# Altium schematic sheet Dahili Moduller 1.SchDoc
size A4; SheetNumber: 4; SheetTotal: 7
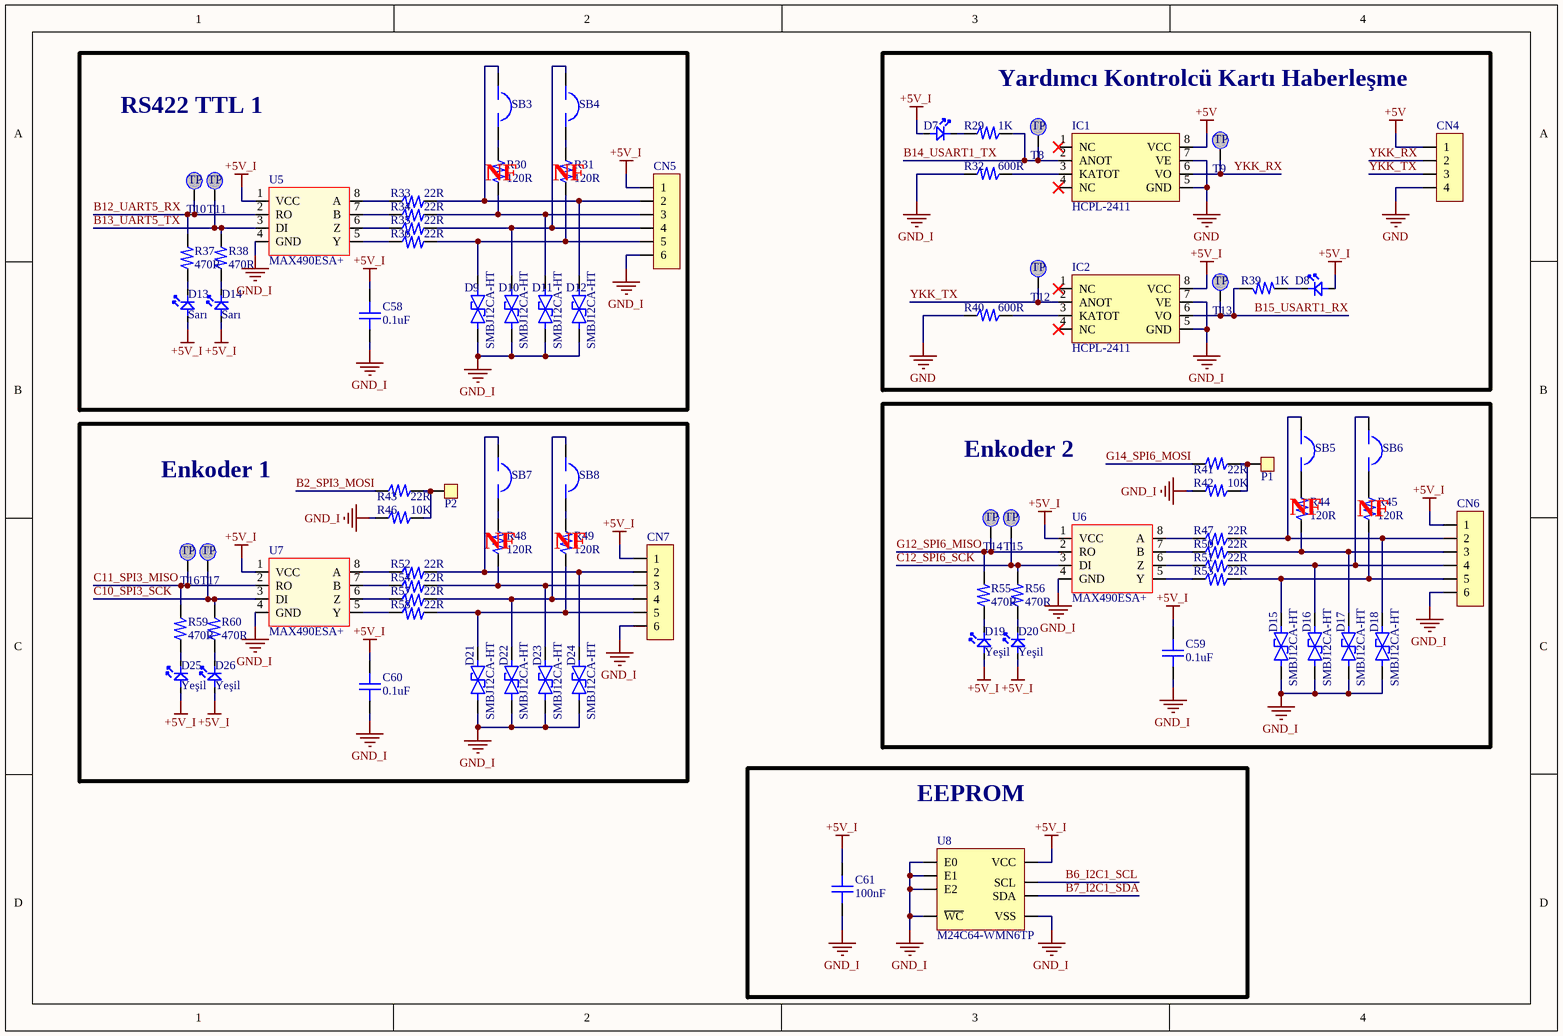
[diagram p0: Dahili Moduller 1.SchDoc]

## Parts
C58  0.1uF  [0805 Kapasıtor]
C59  0.1uF  [0805 Kapasıtor]
C60  0.1uF  [0805 Kapasıtor]
C61  100nF  [0805 Kapasıtor]
CN4  4_Pin_JST_Male  [4_Pin_JST_Male]  (value not drawn)
CN5  6_Pin_JST_Male  [6_Pin_JST_Male]  (value not drawn)
CN6  6_Pin_JST_Male  [6_Pin_JST_Male]  (value not drawn)
CN7  6_Pin_JST_Male  [6_Pin_JST_Male]  (value not drawn)
D7  0805 LED  [0805 LED]  (value not drawn)
D8  0805 LED  [0805 LED]  (value not drawn)
D9  SMBJ12CA-HT  [SMB/DO-214AA]
D10  SMBJ12CA-HT  [SMB/DO-214AA]
D11  SMBJ12CA-HT  [SMB/DO-214AA]
D12  SMBJ12CA-HT  [SMB/DO-214AA]
D13  Sarı  [0805 LED]
D14  Sarı  [0805 LED]
D15  SMBJ12CA-HT  [SMB/DO-214AA]
D16  SMBJ12CA-HT  [SMB/DO-214AA]
D17  SMBJ12CA-HT  [SMB/DO-214AA]
D18  SMBJ12CA-HT  [SMB/DO-214AA]
D19  Yeşil  [0805 LED]
D20  Yeşil  [0805 LED]
D21  SMBJ12CA-HT  [SMB/DO-214AA]
D22  SMBJ12CA-HT  [SMB/DO-214AA]
D23  SMBJ12CA-HT  [SMB/DO-214AA]
D24  SMBJ12CA-HT  [SMB/DO-214AA]
D25  Yeşil  [0805 LED]
D26  Yeşil  [0805 LED]
IC1  HCPL-2411  [DIP8-2.54]
IC2  HCPL-2411  [DIP8-2.54]
P1  ped  [ped]  (value not drawn)
P2  ped  [ped]  (value not drawn)
R29  1K  [0805 Dırenc]
R30  120R  [0805 Dırenc]
R31  120R  [0805 Dırenc]
R32  600R  [0805 Dırenc]
R33  22R  [0805 Dırenc]
R34  22R  [0805 Dırenc]
R35  22R  [0805 Dırenc]
R36  22R  [0805 Dırenc]
R37  470R  [0805 Dırenc]
R38  470R  [0805 Dırenc]
R39  1K  [0805 Dırenc]
R40  600R  [0805 Dırenc]
R41  22R  [0805 Dırenc]
R42  10K  [0805 Dırenc]
R43  22R  [0805 Dırenc]
R44  120R  [0805 Dırenc]
R45  120R  [0805 Dırenc]
R46  10K  [0805 Dırenc]
R47  22R  [0805 Dırenc]
R48  120R  [0805 Dırenc]
R49  120R  [0805 Dırenc]
R50  22R  [0805 Dırenc]
R51  22R  [0805 Dırenc]
R52  22R  [0805 Dırenc]
R53  22R  [0805 Dırenc]
R54  22R  [0805 Dırenc]
R55  470R  [0805 Dırenc]
R56  470R  [0805 Dırenc]
R57  22R  [0805 Dırenc]
R58  22R  [0805 Dırenc]
R59  470R  [0805 Dırenc]
R60  470R  [0805 Dırenc]
SB3  Solder_Bridge  [Solder_Bridge]  (value not drawn)
SB4  Solder_Bridge  [Solder_Bridge]  (value not drawn)
SB5  Solder_Bridge  [Solder_Bridge]  (value not drawn)
SB6  Solder_Bridge  [Solder_Bridge]  (value not drawn)
SB7  Solder_Bridge  [Solder_Bridge]  (value not drawn)
SB8  Solder_Bridge  [Solder_Bridge]  (value not drawn)
T8  Test Noktası  [Test Noktası]  (value not drawn)
T9  Test Noktası  [Test Noktası]  (value not drawn)
T10  Test Noktası  [Test Noktası]  (value not drawn)
T11  Test Noktası  [Test Noktası]  (value not drawn)
T12  Test Noktası  [Test Noktası]  (value not drawn)
T13  Test Noktası  [Test Noktası]  (value not drawn)
T14  Test Noktası  [Test Noktası]  (value not drawn)
T15  Test Noktası  [Test Noktası]  (value not drawn)
T16  Test Noktası  [Test Noktası]  (value not drawn)
T17  Test Noktası  [Test Noktası]  (value not drawn)
U5  MAX490ESA+  [8-SOIC]
U6  MAX490ESA+  [8-SOIC]
U7  MAX490ESA+  [8-SOIC]
U8  M24C64-WMN6TP  [SOIC127P600X175-8N]

## Blocks framed on the sheet
Yardımcı Kontrolcü Kartı Haberleşme: CN4 D7 D8 IC1 IC2 R29 R32 R39 R40 T8 T9 T12 T13
EEPROM: C61 U8

## Nets
+5V: CN4.1 IC1.8(VCC)
+5V_I: C58.2 C59.2 C60.2 C61.2 CN5.1 CN6.1 CN7.1 D7.1 D8.1 D13.1 D14.1 D19.1 D20.1 D25.1 D26.1 IC2.8(VCC) U5.1(VCC) U6.1(VCC) U7.1(VCC) U8.8(VCC)
GND: CN4.4 IC1.5(GND) IC1.7(VE) R40.1
GND_I: C58.1 C59.1 C60.1 C61.1 CN5.6 CN6.6 CN7.6 D9.1 D10.1 D11.1 D12.1 D15.1 D16.1 D17.1 D18.1 D21.1 D22.1 D23.1 D24.1 IC2.5(GND) IC2.7(VE) R32.1 R42.1 R46.1 U5.4(GND) U6.4(GND) U7.4(GND) U8.1(E0) U8.2(E1) U8.3(E2) U8.4(VSS) U8.7(~{WC})
B2_SPI3_MOSI: R43.1
B6_I2C1_SCL: U8.6(SCL)
B7_I2C1_SDA: U8.5(SDA)
B12_UART5_RX: R37.2 T10.1 U5.2(RO)
B13_UART5_TX: R38.2 T11.1 U5.3(DI)
B14_USART1_TX: IC1.2(ANOT) R29.2 T8.1
B15_USART1_RX: IC2.6(VO) R39.2 T13.1
C10_SPI3_SCK: R60.2 T17.1 U7.3(DI)
C11_SPI3_MISO: R59.2 T16.1 U7.2(RO)
C12_SPI6_SCK: R56.2 T15.1 U6.3(DI)
G12_SPI6_MISO: R55.2 T14.1 U6.2(RO)
G14_SPI6_MOSI: R41.1
YKK_RX: CN4.2 IC1.6(VO) T9.1
YKK_TX: CN4.3 IC2.2(ANOT) T12.1
NetCN5_2: CN5.2 D12.2 R33.1 SB3.1
NetCN5_3: CN5.3 D11.2 R30.2 R34.1
NetCN5_4: CN5.4 D10.2 R35.1 SB4.1
NetCN5_5: CN5.5 D9.2 R31.2 R36.1
NetCN6_2: CN6.2 D18.2 R47.1 SB5.1
NetCN6_3: CN6.3 D17.2 R44.2 R50.1
NetCN6_4: CN6.4 D16.2 R51.1 SB6.1
NetCN6_5: CN6.5 D15.2 R45.2 R53.1
NetCN7_2: CN7.2 D24.2 R52.1 SB7.1
NetCN7_3: CN7.3 D23.2 R48.2 R54.1
NetCN7_4: CN7.4 D22.2 R57.1 SB8.1
NetCN7_5: CN7.5 D21.2 R49.2 R58.1
NetD7_2: D7.2 R29.1
NetD8_2: D8.2 R39.1
NetD13_2: D13.2 R37.1
NetD14_2: D14.2 R38.1
NetD19_2: D19.2 R55.1
NetD20_2: D20.2 R56.1
NetD25_2: D25.2 R59.1
NetD26_2: D26.2 R60.1
NetIC1_3: IC1.3(KATOT) R32.2
NetIC2_3: IC2.3(KATOT) R40.2
NetP1_1: P1.1 R41.2 R42.2
NetP2_1: P2.1 R43.2 R46.2
NetR30_1: R30.1 SB3.2
NetR31_1: R31.1 SB4.2
NetR33_2: R33.2 U5.8(A)
NetR34_2: R34.2 U5.7(B)
NetR35_2: R35.2 U5.6(Z)
NetR36_2: R36.2 U5.5(Y)
NetR44_1: R44.1 SB5.2
NetR45_1: R45.1 SB6.2
NetR47_2: R47.2 U6.8(A)
NetR48_1: R48.1 SB7.2
NetR49_1: R49.1 SB8.2
NetR50_2: R50.2 U6.7(B)
NetR51_2: R51.2 U6.6(Z)
NetR52_2: R52.2 U7.8(A)
NetR53_2: R53.2 U6.5(Y)
NetR54_2: R54.2 U7.7(B)
NetR57_2: R57.2 U7.6(Z)
NetR58_2: R58.2 U7.5(Y)

Not connected (* = marked no-connect by the designer): IC1 1(NC)* 4(NC)*; IC2 1(NC)* 4(NC)*

## Notes on the sheet
- RS422 TTL 1
- (near R30) NF
- (near R31) NF
- Enkoder 1
- Enkoder 2
- (near R44) NF
- (near R45) NF
- (near R48) NF
- (near R49) NF
- (in symbol Test Noktası) TP

## Library data of the parts
C58-C61 = Kapasitor 0805
D13 D14 D19 D20 D25 D26 = 0805 LED
R29-R60 = Direnc 0805
SB3-SB8 = Lehim Köprüsü
U5-U7 = MAX490ESA+: Low-Power, Slew-Rate-Limited RS-485/RS-422 Transceivers; Manufacturer_Name: Analog Devices Inc; Copyright: Copyright (C) 2026 Ultra Librarian. All rights reserved.; Manufacturer_Part_Number: MAX490ESA+; RefDes: RefDes; Type: Type
U8 = M24C64-WMN6TP: Package: None; Price: None; Value: *; MP: M24C64-WMN6TP; Availability: Unavailable